# Altium schematic sheet Top.SchDoc
size Letter; SheetNumber: 2; SheetTotal: 15
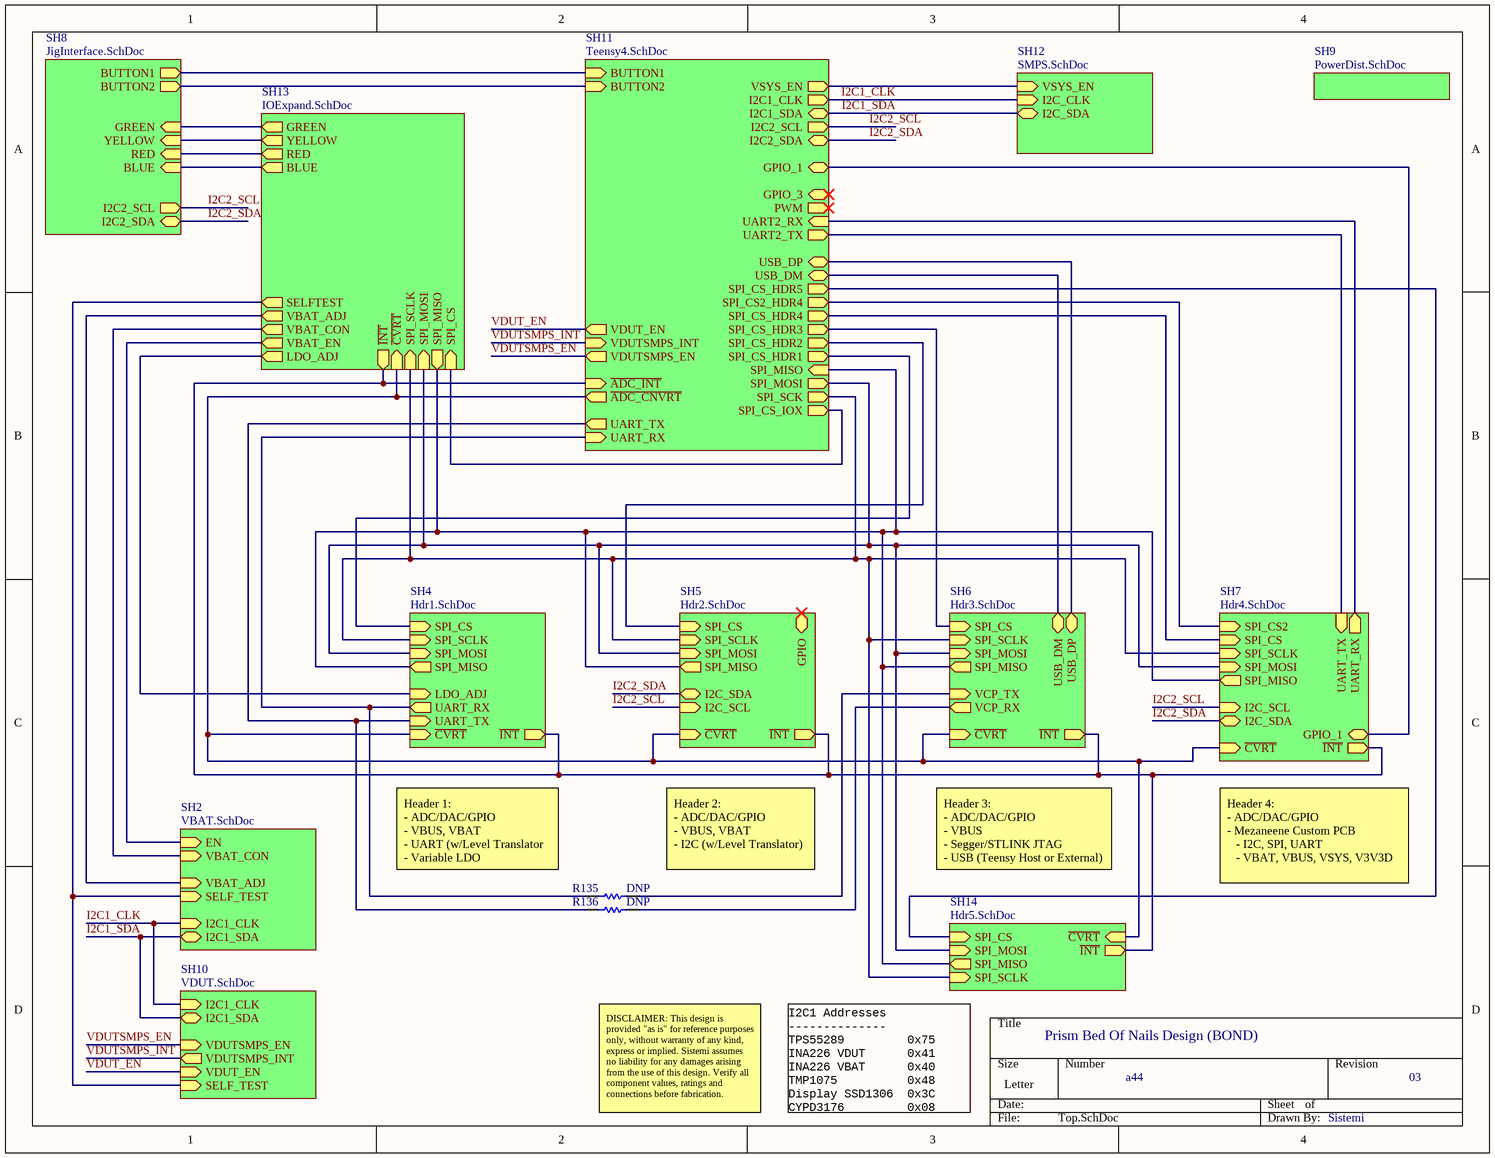
[diagram p0: Top.SchDoc]

## Parts
R135  Resistance: DNP  [RESC1005X40X25NL05T05]  (hidden comment: DNP,±1%,0402)
R136  Resistance: DNP  [RESC1005X40X25NL05T05]  (hidden comment: DNP,±1%,0402)

## Sub-sheets
SH2 = VBAT.SchDoc: I2C1_SDA (bidir), EN (in), VBAT_CON (in), SELF_TEST (in), I2C1_CLK (in), VBAT_ADJ (in)
SH4 = Hdr1.SchDoc: SPI_MOSI (in), SPI_CS (in), ~{INT} (out), SPI_MISO (out), SPI_SCLK (in), ~{CVRT} (in), UART_TX (in), UART_RX (out), LDO_ADJ (in)
SH5 = Hdr2.SchDoc: SPI_SCLK (in), SPI_MISO (out), SPI_MOSI (in), I2C_SDA (bidir), I2C_SCL (in), SPI_CS (in), ~{CVRT} (in), ~{INT} (out), GPIO (bidir)
SH6 = Hdr3.SchDoc: SPI_MOSI (in), SPI_SCLK (in), SPI_CS (in), SPI_MISO (out), ~{INT} (out), ~{CVRT} (in), USB_DP (bidir), USB_DM (bidir), VCP_TX (in), VCP_RX (out)
SH7 = Hdr4.SchDoc: ~{CVRT} (in), SPI_CS2 (in), I2C_SDA (bidir), SPI_SCLK (in), SPI_MOSI (in), SPI_CS (in), I2C_SCL (in), SPI_MISO (out), ~{INT} (out), GPIO_1 (bidir), UART_TX (in), UART_RX (out)
SH8 = JigInterface.SchDoc: BLUE (in), YELLOW (in), RED (in), BUTTON1 (out), GREEN (in), BUTTON2 (out), I2C2_SCL (out), I2C2_SDA (bidir)
SH9 = PowerDist.SchDoc: no entries
SH10 = VDUT.SchDoc: I2C1_SDA (bidir), I2C1_CLK (in), VDUTSMPS_EN (in), VDUTSMPS_INT (out), SELF_TEST (in), VDUT_EN (in)
SH11 = Teensy4.SchDoc: I2C1_CLK (out), SPI_MISO (in), SPI_CS_HDR3 (out), I2C1_SDA (bidir), SPI_SCK (out), SPI_CS_HDR4 (out), SPI_CS_HDR2 (out), SPI_CS2_HDR4 (out), ~{ADC_INT} (in), GPIO_1 (bidir), SPI_CS_HDR1 (out), I2C2_SDA (bidir), I2C2_SCL (out), ~{ADC_CNVRT} (out), SPI_MOSI (out), BUTTON1 (in), BUTTON2 (in), USB_DP (bidir), USB_DM (bidir), UART_TX (out), UART_RX (in), UART2_TX (out), UART2_RX (in), SPI_CS_IOX (out), PWM (out), GPIO_3 (bidir), VDUT_EN (out), VDUTSMPS_INT (in), VDUTSMPS_EN (out), VSYS_EN (out), SPI_CS_HDR5 (out)
SH12 = SMPS.SchDoc: VSYS_EN (in), I2C_CLK (in), I2C_SDA (bidir)
SH13 = IOExpand.SchDoc: SPI_MISO (out), RED (out), YELLOW (out), SPI_SCLK (in), VBAT_EN (out), VBAT_CON (out), ~{CVRT} (in), ~{INT} (out), BLUE (out), SPI_CS (in), SELFTEST (out), SPI_MOSI (in), GREEN (out), VBAT_ADJ (out), LDO_ADJ (out)
SH14 = Hdr5.SchDoc: SPI_CS (in), ~{CVRT} (in), ~{INT} (out), SPI_MOSI (in), SPI_MISO (out), SPI_SCLK (in)

## Nets
I2C1_CLK: sheet SH2/I2C1_CLK, sheet SH10/I2C1_CLK, sheet SH11/I2C1_CLK, sheet SH12/I2C_CLK
I2C1_SDA: sheet SH2/I2C1_SDA, sheet SH10/I2C1_SDA, sheet SH11/I2C1_SDA, sheet SH12/I2C_SDA
I2C2_SCL: sheet SH5/I2C_SCL, sheet SH7/I2C_SCL, sheet SH8/I2C2_SCL, sheet SH11/I2C2_SCL
I2C2_SDA: sheet SH5/I2C_SDA, sheet SH7/I2C_SDA, sheet SH8/I2C2_SDA, sheet SH11/I2C2_SDA
VDUT_EN: sheet SH10/VDUT_EN, sheet SH11/VDUT_EN
VDUTSMPS_EN: sheet SH10/VDUTSMPS_EN, sheet SH11/VDUTSMPS_EN
VDUTSMPS_INT: sheet SH10/VDUTSMPS_INT, sheet SH11/VDUTSMPS_INT
NetR135_1: R135.1 ; sheet SH6/VCP_TX
NetR135_2: R135.2 ; sheet SH4/UART_RX, sheet SH11/UART_RX
NetR136_1: R136.1 ; sheet SH6/VCP_RX
NetR136_2: R136.2 ; sheet SH4/UART_TX, sheet SH11/UART_TX
(unnamed): sheet SH2/EN, sheet SH13/VBAT_EN
(unnamed): sheet SH2/VBAT_CON, sheet SH13/VBAT_CON
(unnamed): sheet SH2/SELF_TEST, sheet SH10/SELF_TEST, sheet SH13/SELFTEST
(unnamed): sheet SH2/VBAT_ADJ, sheet SH13/VBAT_ADJ
(unnamed): sheet SH4/SPI_MOSI, sheet SH5/SPI_MOSI, sheet SH6/SPI_MOSI, sheet SH7/SPI_MOSI, sheet SH11/SPI_MOSI, sheet SH13/SPI_MOSI, sheet SH14/SPI_MOSI
(unnamed): sheet SH4/SPI_CS, sheet SH11/SPI_CS_HDR1
(unnamed): sheet SH4/~{INT}, sheet SH5/~{INT}, sheet SH6/~{INT}, sheet SH7/~{INT}, sheet SH11/~{ADC_INT}, sheet SH13/~{INT}, sheet SH14/~{INT}
(unnamed): sheet SH4/SPI_MISO, sheet SH5/SPI_MISO, sheet SH6/SPI_MISO, sheet SH7/SPI_MISO, sheet SH11/SPI_MISO, sheet SH13/SPI_MISO, sheet SH14/SPI_MISO
(unnamed): sheet SH4/SPI_SCLK, sheet SH5/SPI_SCLK, sheet SH6/SPI_SCLK, sheet SH7/SPI_SCLK, sheet SH11/SPI_SCK, sheet SH13/SPI_SCLK, sheet SH14/SPI_SCLK
(unnamed): sheet SH4/~{CVRT}, sheet SH5/~{CVRT}, sheet SH6/~{CVRT}, sheet SH7/~{CVRT}, sheet SH11/~{ADC_CNVRT}, sheet SH13/~{CVRT}, sheet SH14/~{CVRT}
(unnamed): sheet SH4/LDO_ADJ, sheet SH13/LDO_ADJ
(unnamed): sheet SH5/SPI_CS, sheet SH11/SPI_CS_HDR2
(unnamed): sheet SH6/SPI_CS, sheet SH11/SPI_CS_HDR3
(unnamed): sheet SH6/USB_DP, sheet SH11/USB_DP
(unnamed): sheet SH6/USB_DM, sheet SH11/USB_DM
(unnamed): sheet SH7/SPI_CS2, sheet SH11/SPI_CS2_HDR4
(unnamed): sheet SH7/SPI_CS, sheet SH11/SPI_CS_HDR4
(unnamed): sheet SH7/GPIO_1, sheet SH11/GPIO_1
(unnamed): sheet SH7/UART_TX, sheet SH11/UART2_TX
(unnamed): sheet SH7/UART_RX, sheet SH11/UART2_RX
(unnamed): sheet SH8/BLUE, sheet SH13/BLUE
(unnamed): sheet SH8/YELLOW, sheet SH13/YELLOW
(unnamed): sheet SH8/RED, sheet SH13/RED
(unnamed): sheet SH8/BUTTON1, sheet SH11/BUTTON1
(unnamed): sheet SH8/GREEN, sheet SH13/GREEN
(unnamed): sheet SH8/BUTTON2, sheet SH11/BUTTON2
(unnamed): sheet SH11/SPI_CS_IOX, sheet SH13/SPI_CS
(unnamed): sheet SH11/VSYS_EN, sheet SH12/VSYS_EN
(unnamed): sheet SH11/SPI_CS_HDR5, sheet SH14/SPI_CS

## Notes on the sheet
- Header 1:
  - ADC/DAC/GPIO
  - VBUS, VBAT
  - UART (w/Level Translator
  - Variable LDO
- Header 2:
  - ADC/DAC/GPIO
  - VBUS, VBAT
  - I2C (w/Level Translator)
- Header 3:
  - ADC/DAC/GPIO
  - VBUS
  - Segger/STLINK JTAG
  - USB (Teensy Host or External)
- Header 4:
  - ADC/DAC/GPIO
  - Mezaneene Custom PCB
  - I2C, SPI, UART
  - VBAT, VBUS, VSYS, V3V3D
- Prism Bed Of Nails Design (BOND)
- DISCLAIMER: This design is provided "as is" for reference purposes only, without warranty of any kind, express or implied. Sistemi assumes no liability for any damages arising from the use of this design. Verify all component values, ratings and connections before fabrication.
- I2C1 Addresses
  --------------
  TPS55289         0x75
  INA226 VDUT      0x41
  INA226 VBAT      0x40
  TMP1075          0x48
  Display SSD1306  0x3C
  CYPD3176         0x08
- a44
- 03
- Sistemi

## Library data of the parts
R135 R136 = CMP-3902036-3: Generic RES 0402, =Resistance+','+Tolerance+','+Case; Lead-Free Status: Lead Free; Voltage: 50.0 V; Power: 0.063 W; Mounting Style: Surface Mount; RoHS: Compliant; Number of Pins: 2; Tolerance: ±1%; Octopart Url: TBD; Case: 0402; OctopartID: 26dced8948c2f91b